# Altium project LEFT-Bone_Conduction_Glasses-v1.0.PrjPcb
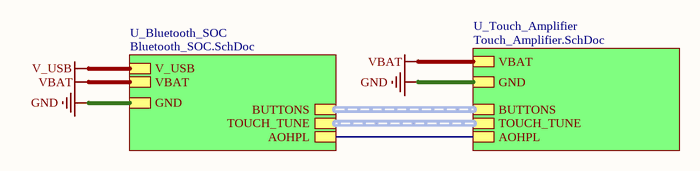
[diagram p0: Top_Sheet.SchDoc]
3 sheets, 85 parts. Net scope: hierarchical (ports join the sheet entries above them; power ports are global).
Board file: Left-PCB-v1.0.PcbDoc
Sheets:
  Top_Sheet.SchDoc
    U_Touch_Amplifier = Touch_Amplifier.SchDoc
    U_Bluetooth_SOC = Bluetooth_SOC.SchDoc

## Sheet Top_Sheet.SchDoc
size A4; SheetNumber: 1; SheetTotal: 3

### Sub-sheets
U_Bluetooth_SOC = Bluetooth_SOC.SchDoc: BUTTONS (harness BUTTONS), TOUCH_TUNE (harness TOUCH_TUNE), GND, VBAT, V_USB, AOHPL
U_Touch_Amplifier = Touch_Amplifier.SchDoc: BUTTONS (harness BUTTONS), TOUCH_TUNE (harness TOUCH_TUNE), GND, VBAT, AOHPL

### Nets
GND: sheet U_Touch_Amplifier/GND, sheet U_Bluetooth_SOC/GND
VBAT: sheet U_Touch_Amplifier/VBAT, sheet U_Bluetooth_SOC/VBAT
AOHPL: sheet U_Touch_Amplifier/AOHPL, sheet U_Bluetooth_SOC/AOHPL

### Buses and harness runs
harness sheet U_Bluetooth_SOC/BUTTONS = sheet U_Touch_Amplifier/BUTTONS
harness sheet U_Bluetooth_SOC/TOUCH_TUNE = sheet U_Touch_Amplifier/TOUCH_TUNE

### Notes on the sheet
- File:
- Title:
- Date:
- Page
- Num:
- Total:
- Drawn By: Huzaifa Ali

## Sheet Touch_Amplifier.SchDoc
size 420 x 297 mm; SheetNumber: 3; SheetTotal: 3
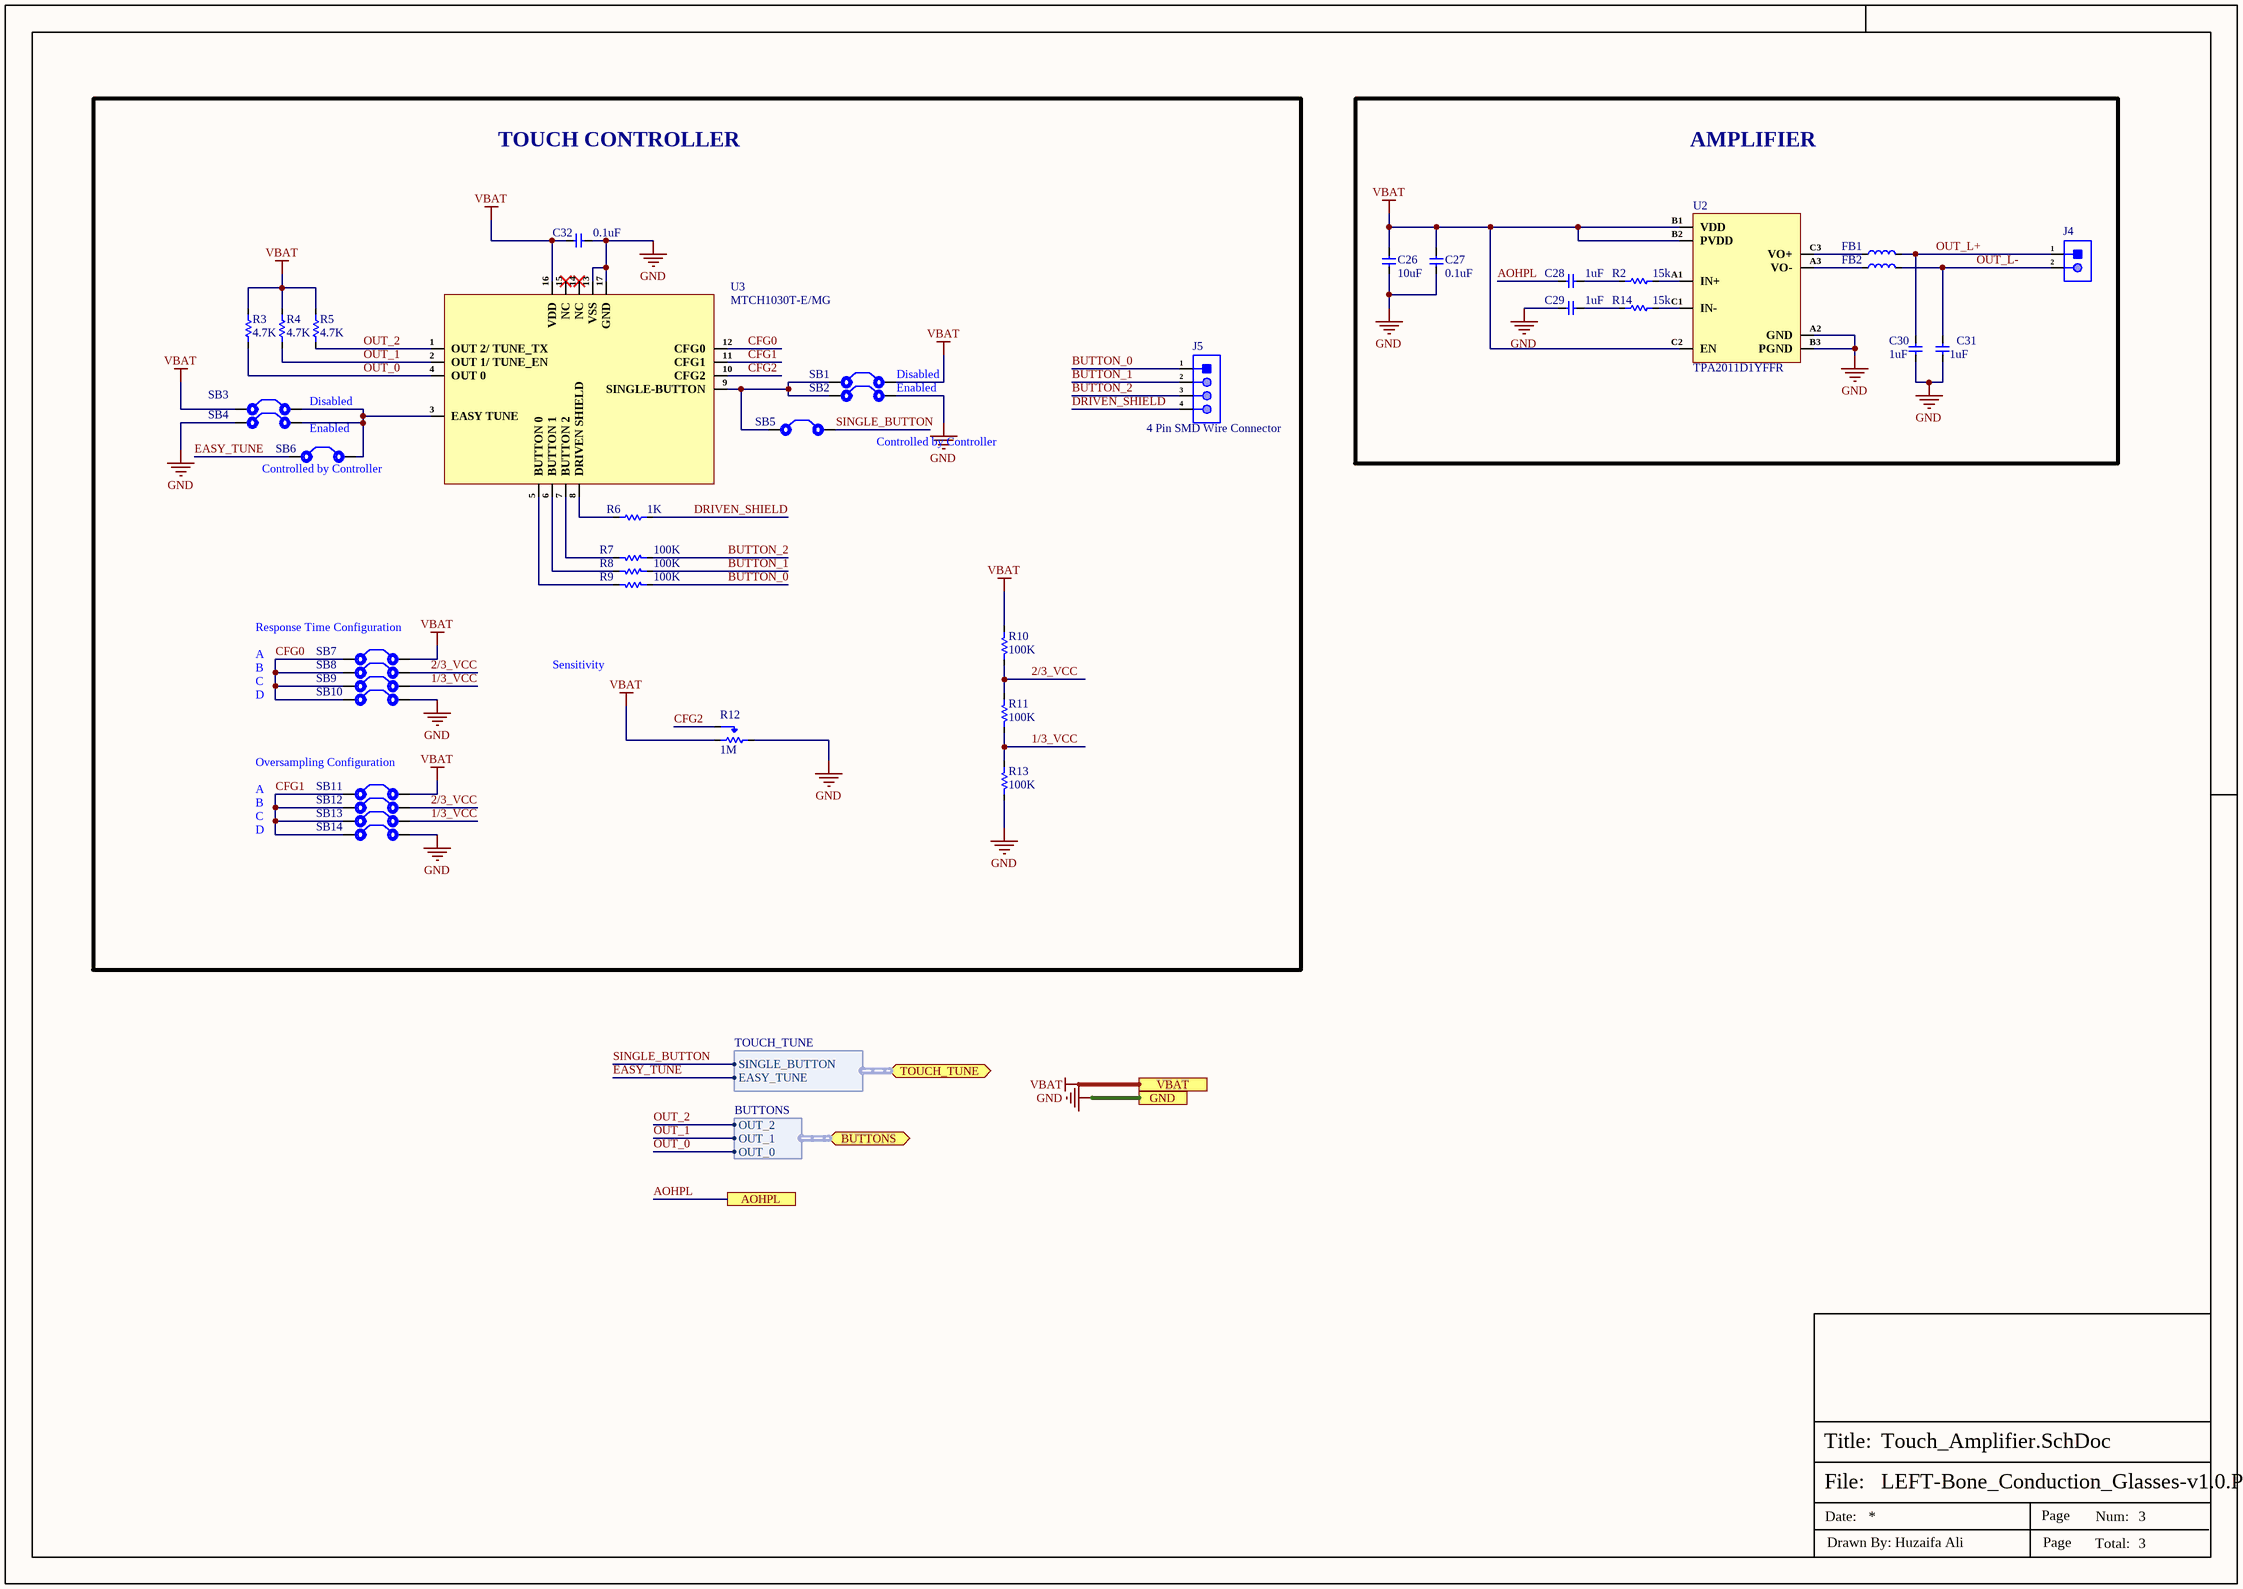
[diagram p1: Touch_Amplifier.SchDoc]

### Parts
C26  10uF  [Cap-0402]
C27  0.1uF  [CAP-0201]
C28  1uF  [Cap-0201]
C29  1uF  [Cap-0201]
C30  1uF  [Cap-0201]
C31  1uF  [Cap-0201]
C32  0.1uF  [CAP-0201]
FB1  MPZ1608S221ATA00  [IND-0603 (1608 Metric)]  (value not drawn)
FB2  MPZ1608S221ATA00  [IND-0603 (1608 Metric)]  (value not drawn)
J4  2 Test Pad  [2 Test Pad]  (value not drawn)
J5  4 Pin SMD Wire Connector  [4 Pin SMD Wire CON.]
R2  15k  [Res-0201]
R3  4.7K  [Res-0201]
R4  4.7K  [Res-0201]
R5  4.7K  [Res-0201]
R6  1K  [Res-0201]
R7  100K  [Res-0201]
R8  100K  [Res-0201]
R9  100K  [Res-0201]
R10  100K  [Res-0201]
R11  100K  [Res-0201]
R12  1M  [TC33X-2-105E]
R13  100K  [Res-0201]
R14  15k  [Res-0201]
SB1  Solder Bridge 0402  [Solder Bridge 0402]  (value not drawn)
SB2  Solder Bridge 0402  [Solder Bridge 0402]  (value not drawn)
SB3  Solder Bridge 0402  [Solder Bridge 0402]  (value not drawn)
SB4  Solder Bridge 0402  [Solder Bridge 0402]  (value not drawn)
SB5  Solder Bridge 0402  [Solder Bridge 0402]  (value not drawn)
SB6  Solder Bridge 0402  [Solder Bridge 0402]  (value not drawn)
SB7  Solder Bridge 0402  [Solder Bridge 0402]  (value not drawn)
SB8  Solder Bridge 0402  [Solder Bridge 0402]  (value not drawn)
SB9  Solder Bridge 0402  [Solder Bridge 0402]  (value not drawn)
SB10  Solder Bridge 0402  [Solder Bridge 0402]  (value not drawn)
SB11  Solder Bridge 0402  [Solder Bridge 0402]  (value not drawn)
SB12  Solder Bridge 0402  [Solder Bridge 0402]  (value not drawn)
SB13  Solder Bridge 0402  [Solder Bridge 0402]  (value not drawn)
SB14  Solder Bridge 0402  [Solder Bridge 0402]  (value not drawn)
U2  TPA2011D1YFFR  [9-DSBGA]
U3  MTCH1030T-E/MG  [16-QFN (3x3).]

### Blocks framed on the sheet
TOUCH CONTROLLER: C32 J5 R3-R13 SB1-SB14 U3
AMPLIFIER: C26-C31 FB1 FB2 J4 R2 R14 U2

### Ports
AOHPL, BUTTONS (bidir, harness BUTTONS), GND, TOUCH_TUNE (bidir, harness TOUCH_TUNE), VBAT

### Harnesses
BUTTONS: OUT_2, OUT_1, OUT_0
TOUCH_TUNE: SINGLE_BUTTON, EASY_TUNE

### Nets
GND: C26.1 C27.1 C29.1 C30.1 C31.1 C32.2 R12.3(CW) R13.2 SB2.1 SB4.1 SB10.2 SB14.2 U2.A2(GND) U2.B3(PGND) U3.13(VSS) U3.17(GND) ; port GND
VBAT: C26.2 C27.2 C32.1 R3.2 R4.2 R5.2 R10.1 R12.1(CCW) SB1.1 SB3.1 SB7.2 SB11.2 U2.B1(VDD) U2.B2(PVDD) U2.C2(EN) U3.16(VDD) ; port VBAT
1/3_VCC: R11.2 R13.1 SB9.2 SB13.2
2/3_VCC: R10.2 R11.1 SB8.2 SB12.2
AOHPL: C28.1 ; port AOHPL
BUTTON_0: J5.1 R9.1
BUTTON_1: J5.2 R8.1
BUTTON_2: J5.3 R7.1
CFG0: SB7.1 SB8.1 SB9.1 SB10.1 U3.12(CFG0)
CFG1: SB11.1 SB12.1 SB13.1 SB14.1 U3.11(CFG1)
CFG2: R12.2(Wiper) U3.10(CFG2)
DRIVEN_SHIELD: J5.4 R6.2
EASY_TUNE: SB6.1 ; port TOUCH_TUNE.EASY_TUNE
OUT_0: R3.1 U3.4(OUT_0) ; port BUTTONS.OUT_0
OUT_1: R4.1 U3.2(OUT_1/_TUNE_EN) ; port BUTTONS.OUT_1
OUT_2: R5.1 U3.1(OUT_2/_TUNE_TX) ; port BUTTONS.OUT_2
OUT_L+: C30.2 FB1.2 J4.1
OUT_L-: C31.2 FB2.2 J4.2
SINGLE_BUTTON: SB5.1 ; port TOUCH_TUNE.SINGLE_BUTTON
NetC28_2: C28.2 R2.1
NetC29_2: C29.2 R14.1
NetFB1_1: FB1.1 U2.C3(VO+)
NetFB2_1: FB2.1 U2.A3(VO-)
NetR2_2: R2.2 U2.A1(IN+)
NetR6_1: R6.1 U3.8(DRIVEN_SHIELD)
NetR7_2: R7.2 U3.7(BUTTON_2)
NetR8_2: R8.2 U3.6(BUTTON_1)
NetR9_2: R9.2 U3.5(BUTTON_0)
NetR14_2: R14.2 U2.C1(IN-)
NetSB1_2: SB1.2 SB2.2 SB5.2 U3.9(SINGLE-BUTTON)
NetSB3_2: SB3.2 SB4.2 SB6.2 U3.3(EASY_TUNE)

Not connected (* = marked no-connect by the designer): U3 14(NC)* 15(NC)*

### Notes on the sheet
- Enabled
- Disabled
- (near SB5) Controlled by Controller
- (near SB6) Controlled by Controller
- Text
- Sensitivity
- Response Time Configuration
  A
  B
  C
  D
- Oversampling Configuration
  A
  B
  C
  D
- File:
- Title:
- Date:
- Page
- Num:
- Total:
- Drawn By: Huzaifa Ali

### Library data of the parts
C26 = CL05A106MP5NUNC: CAP CER 10UF 10V X5R 0402; Manufacturer: Samsung; Tolerance: 20%; Item Type: Capacitor; Supplier 1: Avnet; Manufacturer Part Number: CL05A106MP5NUNC; RoHS: Yes; Category: Ceramic Capacitors; Stock 1: 1729850; Pricing 1: 10000=0.02537 (USD); Mount: Surface Mount; Case/Package: 0402; Case Code (Metric): 1005; Case Code (Imperial): 0402; Contact Plating: Tin; Min Operating Temperature: -55°C; Max Operating Temperature: 85°C; Package Quantity: 1; Packaging: Tape and Reel; Capacitance: 10uF; Voltage Rating: 10V; Dielectric: X5R; Termination: Wraparound; Series: CL; Construction: Flat; Length: 1mm; Width: 0.02inch; Thickness: 0.028inch; Depth: 0.5mm; Radiation Hardening: No; Lead Free: Lead Free; RoHS Compliant: Yes; ComponentLink1URL: https://datasheet.ciiva.com/25721/cl05a106mp5nunc-25721584.pdf?src-supplier=Digi-Key; ComponentLink1Description: https://datasheet.ciiva.com/25721/cl05a106mp5nunc-25721584.pdf?src-supplier=Digi-Key; ComponentLink2URL: https://datasheet.ciiva.com/26838/getdatasheetpartid-745310-26838170.pdf?src-supplier=Verical; ComponentLink2Description: https://datasheet.ciiva.com/26838/getdatasheetpartid-745310-26838170.pdf?src-supplier=Verical; Supplier Part Number 1: CL05A106MP5NUNC; LCSC Part Number: C315248
C27 C32 = CC0201KRX5R6BB104: CAP CER 0.1UF 10V X5R 0201; Manufacturer: Yageo; Capacitance: 100nF; Tolerance: 10%; Supplier 1: Mouser; Manufacturer Part Number: CC0201KRX5R6BB104; RoHS: Yes; Category: Ceramic Capacitors; Stock 1: 824403; Pricing 1: 1=0.10000, 10=0.02400, 50=0.02400, 100=0.01900, 1000=0.01100, 10000=0.00900 (USD); Mount: Surface Mount; Case/Package: 0201; Case Code (Imperial): 0201; Case Code (Metric): 0603; Weight: 6E-06oz; Min Operating Temperature: -55°C; Max Operating Temperature: 85°C; Dielectric: X5R; Voltage Rating (DC): 10V; Packaging: Tape and Reel; Termination: SMD/SMT; Resistor Type: Ceramic; Voltage Rating: 10V; Series: CC; Construction: Flat; Length: 0.6mm; Width: 0.012inch; Height: 0.3mm; Thickness: 0.013inch; Depth: 0.3mm; Radiation Hardening: No; Lead Free: Lead Free; Halogen Free: Halogen Free; RoHS Compliant: Yes; ComponentLink1URL: https://datasheet.ciiva.com/11587/upy-gphc-x5r-4v-to-50v-12-11587190.pdf?src-supplier=Avnet; ComponentLink1Description: https://datasheet.ciiva.com/11587/upy-gphc-x5r-4v-to-50v-12-11587190.pdf?src-supplier=Avnet; Supplier Part Number 1: 603-CC201KRX5R6BB104; LCSC Part Number: C190183
C28-C31 = CC0201KRX5R5BB105: CAP CER 1UF 6.3V X5R 0201; Manufacturer: Yageo; Tolerance: 10%; Item Type: Capacitor; Supplier 1: Arrow Electronics; Manufacturer Part Number: CC0201KRX5R5BB105; RoHS: Yes; Category: Ceramic Capacitors; Stock 1: 600000; Pricing 1: 15000=0.00740 (USD); Mount: Surface Mount; Case/Package: 0201; Case Code (Imperial): 0201; Case Code (Metric): 0603; Min Operating Temperature: -55°C; Max Operating Temperature: 85°C; Packaging: Cut Tape; Capacitance: 1uF; Voltage Rating: 6.3V; RoHS Compliant: Yes; ComponentLink1URL: http://www.yageo.com/documents/recent/UPY-GPHC_X5R_4V-to-50V_25.pdf?src-supplier=Digi-Key; ComponentLink1Description: http://www.yageo.com/documents/recent/UPY-GPHC_X5R_4V-to-50V_25.pdf?src-supplier=Digi-Key; ComponentLink2URL: https://www.yageo.com/upload/media/product/productsearch/datasheet/mlcc/UPY-GPHC_X5R_4V-to-50V_26.pdf?src-supplier=Digi-Key; ComponentLink2Description: https://www.yageo.com/upload/media/product/productsearch/datasheet/mlcc/UPY-GPHC_X5R_4V-to-50V_26.pdf?src-supplier=Digi-Key; Supplier Part Number 1: CC0201KRX5R5BB105; LCSC Part Number: C541330
FB1 FB2 = MPZ1608S221ATA00: FERRITE BEAD 220 OHM 0603 1LN; Manufacturer: TDK; Current Rating: 2.2A; Tolerance: 25%; Impedance: 220R; DC Resistance (DCR): 50mR; Test Frequency: 100MHz; Number of Lines: 1; Supplier: Avnet; Supplier Part Number: MPZ1608S221ATA00; Manufacturer Part Number: MPZ1608S221ATA00; RoHS: Yes; Category: Ferrite Beads and Chips; Stock: 4000; Pricing: 4000=0.02405, 8000=0.02275, 16000=0.02145, 24000=0.01953, 32000=0.01827 (USD); Mounting Technology: Surface Mount; Case/Package: 0603; Pins: 2; Case Code (Imperial): 0603; Core Material: Ferrite; Case Code (Metric): 1608; Packaging: Cut Tape; Package Quantity: 1; Max DC Current: 2.2A; Series: MPZ; Max Current Rating: 2.2A; RMS Current (Irms): 2.2A; ESR: 50mR; Length: 0.063inch; Width: 0.031inch; Height: 0.037inch; Lead Free: Lead Free; RoHS Compliant: Yes; Reach SVHC Compliant: No; ComponentLink1URL: https://datasheet.ciiva.com/8077/55167-8077073.pdf?src-supplier=Element14; ComponentLink1Description: https://datasheet.ciiva.com/8077/55167-8077073.pdf?src-supplier=Element14; ComponentLink2URL: https://datasheet.ciiva.com/8077/55167-8077071.pdf?src-supplier=Element14; ComponentLink2Description: https://datasheet.ciiva.com/8077/55167-8077071.pdf?src-supplier=Element14; ComponentLink3URL: https://datasheet.ciiva.com/46381/1486324-46381628.pdf?src-supplier=Element14; ComponentLink3Description: https://datasheet.ciiva.com/46381/1486324-46381628.pdf?src-supplier=Element14; ComponentLink4URL: https://datasheet.ciiva.com/46366/print-detail-pdf-phplangenpart-nompz1608s221ata00nreimp-unit-xmhz-46366044.pdf?src-supplier=Onlinecomponents.com; ComponentLink4Description: https://datasheet.ciiva.com/46366/print-detail-pdf-phplangenpart-nompz1608s221ata00nreimp-unit-xmhz-46366044.pdf?src-supplier=Onlinecomponents.com; LCSC Part Number: C76815; Item Type: Ferrite Bead
J4 = 2 Test Pad: Wire Connecting Pad; Item Type: Test Point; Manufacturer Part Number: 2 Test Pad
J5 = 4 Pin SMD Wire Connector: Wire Connecting Pads; Item Type: SMD Pads; Manufacturer Part Number: 4 Pin SMD Wire Connector
R2 R14 = RC0201FR-0715KL: RES 15K OHM 1% 1/20W 0201; Manufacturer: Yageo; Voltage Rating (DC): 25V; Item Type: Resistor; Supplier 1: Future Electronics; Manufacturer Part Number: RC0201FR-0715KL; RoHS: Yes; Category: Chip SMD Resistors; Stock 1: 360000; Pricing 1: 10000=0.0035, 50000=0.0033, 250000=0.0031, 750000=0.003, 2000000=0.0028 (USD); Lead Free: 5697LeadFree; ComponentLink1URL: https://datasheet.ciiva.com/6002/1563626-6002808.pdf?src-supplier=Farnell; ComponentLink1Description: https://datasheet.ciiva.com/6002/1563626-6002808.pdf?src-supplier=Farnell; ComponentLink2URL: https://datasheet.ciiva.com/22661/1563626-22661288.pdf?src-supplier=Element14; ComponentLink2Description: https://datasheet.ciiva.com/22661/1563626-22661288.pdf?src-supplier=Element14; Supplier Part Number 1: 9770686; LCSC Part Number: C295774
R3-R5 = RC0201FR-074K7L: RES 4.7K OHM 1% 1/20W 0201; Manufacturer: Yageo; Item Type: Resistor; Supplier: Future Electronics; Supplier Part Number: 7537285; Manufacturer Part Number: RC0201FR-074K7L; RoHS: Yes; Category: Chip SMD Resistors; Stock: 1610000; Pricing: 10000=0.0014, 50000=0.0013, 250000=0.0013, 750000=0.0012, 2000000=0.0011 (USD); ComponentLink1URL: https://datasheet.ciiva.com/2493/pyu-r-int-thick-7-2493811.pdf?src-supplier=Digi-Key; ComponentLink1Description: https://datasheet.ciiva.com/2493/pyu-r-int-thick-7-2493811.pdf?src-supplier=Digi-Key; ComponentLink2URL: https://datasheet.ciiva.com/2493/pyu-r-int-thick-7-2493812.pdf?src-supplier=Digi-Key; ComponentLink2Description: https://datasheet.ciiva.com/2493/pyu-r-int-thick-7-2493812.pdf?src-supplier=Digi-Key; ComponentLink3URL: https://datasheet.ciiva.com/2493/pyu-r-int-thick-7-2493813.pdf?src-supplier=Digi-Key; ComponentLink3Description: https://datasheet.ciiva.com/2493/pyu-r-int-thick-7-2493813.pdf?src-supplier=Digi-Key; ComponentLink4URL: https://datasheet.ciiva.com/8892/pyu-rc0201-51-rohs-l-8-8892942.pdf?src-supplier=Avnet; ComponentLink4Description: https://datasheet.ciiva.com/8892/pyu-rc0201-51-rohs-l-8-8892942.pdf?src-supplier=Avnet; ComponentLink5URL: https://datasheet.ciiva.com/7672/1563626-7672233.pdf?src-supplier=Element14; ComponentLink5Description: https://datasheet.ciiva.com/7672/1563626-7672233.pdf?src-supplier=Element14; LCSC Part Number: C138135
R6 = RC0201FR-071KP: RES 1K OHM 1% 1/20W 0201; Manufacturer: Yageo; Supplier 1: Digi-Key; Manufacturer Part Number: RC0201FR-071KP; RoHS: Yes; Stock 1: 4800; Pricing 1: 1=0.11000, 10=0.10200, 100=0.03940, 1000=0.01734, 2500=0.01497, 5000=0.01340 (USD); RoHS Compliant: Yes; Supplier Part Number 1: 13-RC0201FR-071KPCT-ND; LCSC Part Number: C3953443
R7-R11 R13 = RC0201FR-07100KL: RES 100K OHM 1% 1/20W 0201; Manufacturer: Yageo; Resistance: 100kR; Temperature Coefficient: 200ppm/°C; Power Rating: 50mW; Voltage Rating: 25V; Supplier 1: Digi-Key; Manufacturer Part Number: RC0201FR-07100KL; RoHS: Yes; Category: Chip SMD Resistors; Stock 1: 6740592; Pricing 1: 1=0.10000, 10=0.03900, 100=0.01570, 1000=0.00705, 2500=0.00612, 5000=0.00506 (USD); Case/Package: 0201; Number of Pins: 2; Contact Plating: Tin,Matte; Case Code (Imperial): 0201; Case Code (Metric): 0603; Size Code: 0201; Min Operating Temperature: -55°C; Max Operating Temperature: 125°C; Tolerance: 1%; Resistor Type: Thick Film; Packaging: Tape and Reel; Package Quantity: 10000; Termination: SMD/SMT; Number of Terminations: 2; Max Power Dissipation: 50mW; Voltage Rating (DC): 25V; Features: Moisture Resistant; Series: RC; Resistance Tolerance: 1%; Construction: Rectangular; Length: 0.024inch; Width: 0.012inch; Height: 0.01inch; Depth: 0.3mm; REACH SVHC: No SVHC; Military Standard: Not; Lead Free: Lead Free; RoHS Compliant: Yes; ComponentLink1URL: https://datasheet.ciiva.com/7660/1421516-7660806.pdf?src-supplier=Element14; ComponentLink1Description: https://datasheet.ciiva.com/7660/1421516-7660806.pdf?src-supplier=Element14; ComponentLink2URL: https://datasheet.ciiva.com/22698/1563626-22698495.pdf?src-supplier=Element14; ComponentLink2Description: https://datasheet.ciiva.com/22698/1563626-22698495.pdf?src-supplier=Element14; ComponentLink3URL: https://datasheet.ciiva.com/46391/1421516-46391338.pdf?src-supplier=Element14; ComponentLink3Description: https://datasheet.ciiva.com/46391/1421516-46391338.pdf?src-supplier=Element14; ComponentLink4URL: https://datasheet.ciiva.com/2493/pyu-r-int-thick-7-2493770.pdf?src-supplier=Digi-Key; ComponentLink4Description: https://datasheet.ciiva.com/2493/pyu-r-int-thick-7-2493770.pdf?src-supplier=Digi-Key; ComponentLink5URL: https://datasheet.ciiva.com/2493/pyu-r-int-thick-7-2493771.pdf?src-supplier=Digi-Key; ComponentLink5Description: https://datasheet.ciiva.com/2493/pyu-r-int-thick-7-2493771.pdf?src-supplier=Digi-Key; ComponentLink6URL: https://datasheet.ciiva.com/2493/pyu-r-int-thick-7-2493769.pdf?src-supplier=Digi-Key; ComponentLink6Description: https://datasheet.ciiva.com/2493/pyu-r-int-thick-7-2493769.pdf?src-supplier=Digi-Key; ComponentLink7URL: https://datasheet.ciiva.com/26829/getdatasheetpartid-420441-26829850.pdf?src-supplier=Verical; ComponentLink7Description: https://datasheet.ciiva.com/26829/getdatasheetpartid-420441-26829850.pdf?src-supplier=Verical; Supplier Part Number 1: 311-100KMCT-ND
R12 = TC33X-2-105E: TRIMMER 1M OHM 0.1W J LEAD TOP; Manufacturer: Bourns; Item Type: Variable Resistor; Supplier: Arrow Electronics; Supplier Part Number: TC33X-2-105E; Manufacturer Part Number: TC33X-2-105E; RoHS: Yes; Category: Variable Resistors and Potentiometers; Stock: 5461; Pricing: 1=0.2738, 10=0.235, 25=0.2264, 100=0.2108, 250=0.2012, 500=0.1814, 1000=0.1356, 3000=0.126 (USD); ComponentLink1URL: https://datasheet.ciiva.com/6227/tc33-6227126.pdf?src-supplier=Digi-Key; ComponentLink1Description: https://datasheet.ciiva.com/6227/tc33-6227126.pdf?src-supplier=Digi-Key; ComponentLink2URL: https://datasheet.ciiva.com/43453/306tc33-43453797.pdf?src-supplier=Onlinecomponents.com; ComponentLink2Description: https://datasheet.ciiva.com/43453/306tc33-43453797.pdf?src-supplier=Onlinecomponents.com; LCSC Part Number: C5362465
SB1-SB14 = Solder Bridge 0402: Solder Bridge ON; Manufacturer Part Number: Solder Bridge 0402; Item Type: Solder Bridge
U2 = TPA2011D1YFFR: IC AMP AUDIO PWR 3.2W D 9DSBGA; Manufacturer: Texas Instruments; Max Power Dissipation: 525mW; Max Supply Voltage: 5.5V; Min Supply Voltage: 2.5V; Max Output Power: 3.24W; Number of Channels: 1; Power Supply Rejection Ratio (PSRR): 86dB; Quiescent Current: 1.8mA; Supply Current: 1.5mA; Supplier 1: Mouser; Manufacturer Part Number: TPA2011D1YFFR; RoHS: Yes; Category: Amplifiers - Audio; Stock 1: 6964; Pricing 1: 1=0.83, 10=0.698, 50=0.698, 100=0.529, 1000=0.353, 10000=0.293 (USD); Case/Package: BGA; Number of Pins: 9; Min Operating Temperature: -40°C; Max Operating Temperature: 85°C; Output Power: 3.2W; Series: -; Packaging: Tape and Reel; Package Quantity: 3000; Power Dissipation: 525mW; Radiation Hardening: No; Lead Free: Lead Free; RoHS Compliant: Yes; ComponentLink1URL: https://datasheet.ciiva.com/1789/tpa2011d1-1789073.pdf?src-supplier=Digi-Key; ComponentLink1Description: https://datasheet.ciiva.com/1789/tpa2011d1-1789073.pdf?src-supplier=Digi-Key; ComponentLink2URL: https://datasheet.ciiva.com/1789/tpa2011d1-1789074.pdf?src-supplier=Digi-Key; ComponentLink2Description: https://datasheet.ciiva.com/1789/tpa2011d1-1789074.pdf?src-supplier=Digi-Key; ComponentLink3URL: https://datasheet.ciiva.com/1789/tpa2011d1-1789075.pdf?src-supplier=Digi-Key; ComponentLink3Description: https://datasheet.ciiva.com/1789/tpa2011d1-1789075.pdf?src-supplier=Digi-Key; ComponentLink4URL: https://datasheet.ciiva.com/15223/getdatasheetpartid-306371-15223959.pdf?src-supplier=Verical; ComponentLink4Description: https://datasheet.ciiva.com/15223/getdatasheetpartid-306371-15223959.pdf?src-supplier=Verical; Supplier Part Number 1: 595-TPA2011D1YFFR; LCSC Part Number: C468251; Item Type: IC
U3 = MTCH1030T-E/MG: 3 CHANNEL TOUCH CONTROLLER, GPIO; Manufacturer: Microchip; Item Type: IC; Supplier: Digi-Key; Supplier Part Number: 150-MTCH1030T-E/MGCT-ND; Manufacturer Part Number: MTCH1030T-E/MG; RoHS: No; Stock: 3300; Pricing: 1=1, 25=0.92, 100=0.83 (USD)

## Sheet Bluetooth_SOC.SchDoc
size 420 x 297 mm; SheetNumber: 2; SheetTotal: 3
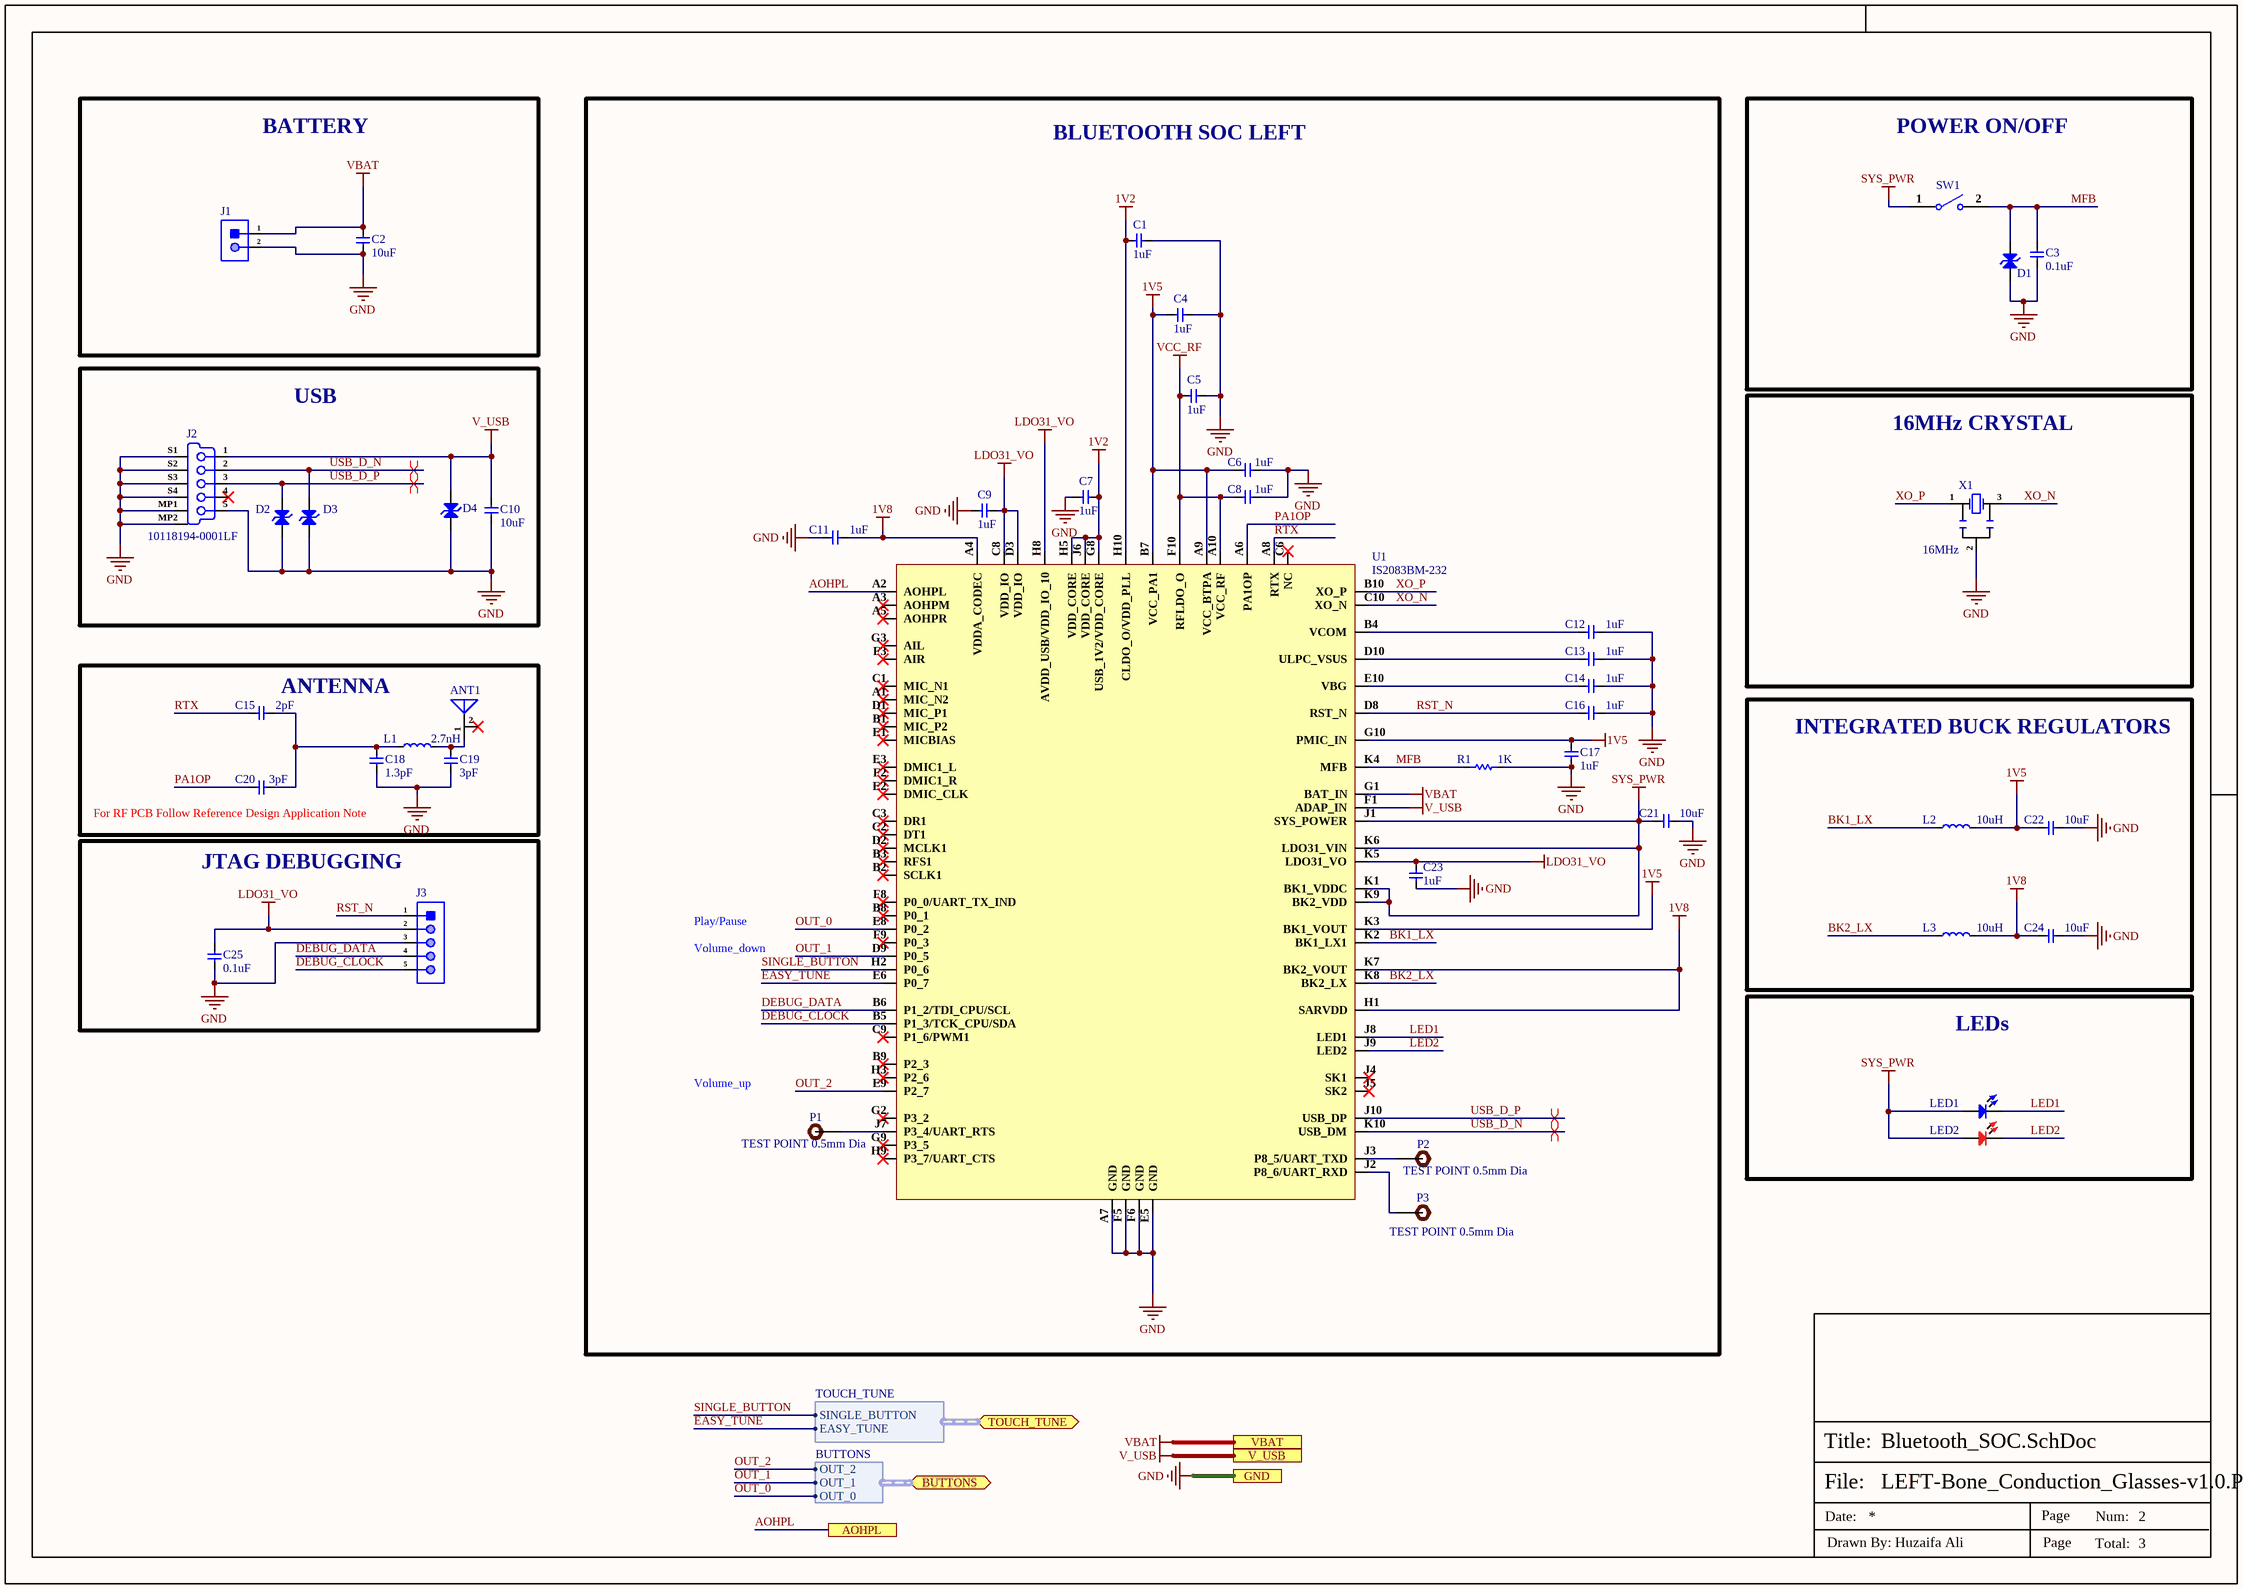
[diagram p2: Bluetooth_SOC.SchDoc]

### Parts
ANT1  ANT3216LL00R2400A  [ANT3216LL00R2400A]  (value not drawn)
C1  1uF  [Cap-0201]
C2  10uF  [Cap-0402]
C3  0.1uF  [CAP-0201]
C4  1uF  [Cap-0201]
C5  1uF  [Cap-0201]
C6  1uF  [Cap-0201]
C7  1uF  [Cap-0201]
C8  1uF  [Cap-0201]
C9  1uF  [Cap-0201]
C10  10uF  [Cap-0402]
C11  1uF  [Cap-0201]
C12  1uF  [Cap-0201]
C13  1uF  [Cap-0201]
C14  1uF  [Cap-0201]
C15  2pF  [CAP-0201]
C16  1uF  [Cap-0201]
C17  1uF  [Cap-0201]
C18  1.3pF  [CAP-0201]
C19  3pF  [CAP-0201]
C20  3pF  [CAP-0201]
C21  10uF  [Cap-0402]
C22  10uF  [Cap-0402]
C23  1uF  [Cap-0201]
C24  10uF  [Cap-0402]
C25  0.1uF  [CAP-0201]
D1  PESD5V0H1BSFYL  [DSN0603-2]  (value not drawn)
D2  PESD5V0H1BSFYL  [DSN0603-2]  (value not drawn)
D3  PESD5V0H1BSFYL  [DSN0603-2]  (value not drawn)
D4  PESD5V0H1BSFYL  [DSN0603-2]  (value not drawn)
J1  2 Test Pad  [2 Test Pad]  (value not drawn)
J2  10118194-0001LF  [10118194-0001LF_]
J3  5 Test Pad  [5 Test Pad]  (value not drawn)
L1  2.7nH  [IND-0201]
L2  10uH  [IND-0603 (1608 Metric)]
L3  10uH  [IND-0603 (1608 Metric)]
LED1  Blue  [LED-0603]  (value not drawn)
LED2  RED  [LED-0603]  (value not drawn)
P1  TEST POINT 0.5mm Dia  [Test-point - 0.5mm]
P2  TEST POINT 0.5mm Dia  [Test-point - 0.5mm]
P3  TEST POINT 0.5mm Dia  [Test-point - 0.5mm]
R1  1K  [Res-0201]
SW1  B3U-1000P  [B3U-1000P]  (value not drawn)
U1  IS2083BM-232  [82-VFBGA]
X1  16MHz  [SMD3213-3P]

### Blocks framed on the sheet
BATTERY: C2 J1
BLUETOOTH SOC LEFT: C1 C4-C9 C11-C14 C16 C17 C21 C23 P1-P3 R1 U1
POWER ON/OFF: C3 D1 SW1
USB: C10 D2-D4 J2
16MHz CRYSTAL: X1
ANTENNA: ANT1 C15 C18-C20 L1
INTEGRATED BUCK REGULATORS: C22 C24 L2 L3
JTAG DEBUGGING: C25 J3
LEDs: LED1 LED2

### Ports
AOHPL, BUTTONS (bidir, harness BUTTONS), GND, TOUCH_TUNE (bidir, harness TOUCH_TUNE), V_USB, VBAT

### Harnesses
BUTTONS: OUT_2, OUT_1, OUT_0
TOUCH_TUNE: SINGLE_BUTTON, EASY_TUNE

### Nets
1V2: C1.1 C7.1 U1.G8(USB_1V2/VDD_CORE) U1.H5(VDD_CORE) U1.H10(CLDO_O/VDD_PLL) U1.J6(VDD_CORE)
1V5: C4.2 C6.2 C17.2 C22.2 L2.2 U1.A9(VCC_BTPA) U1.B7(VCC_PA1) U1.G10(PMIC_IN) U1.K3(BK1_VOUT)
1V8: C11.2 C24.2 L3.2 U1.A4(VDDA_CODEC) U1.H1(SARVDD) U1.K7(BK2_VOUT)
GND: C1.2 C2.2 C3.1 C4.1 C5.1 C6.1 C7.2 C8.1 C9.2 C10.2 C11.1 C12.2 C13.2 C14.2 C16.2 C17.1 C18.1 C19.1 C21.1 C22.1 C23.1 C24.1 C25.1 D1.1(A) D2.1(A) D3.1(A) D4.1(A) J1.2 J2.5(GND) J2.MP1(Tab) J2.MP2(Tab) J2.S1(Shield) J2.S2(Shield) J2.S3(Shield) J2.S4(Shield) J3.3 R1.2 U1.A7(GND) U1.E5(GND) U1.F5(GND) U1.F6(GND) X1.2 ; port GND
LDO31_VO: C9.1 C23.2 C25.2 J3.2 U1.C8(VDD_IO) U1.D3(VDD_IO) U1.H8(AVDD_USB/VDD_IO_10) U1.K5(LDO31_VO)
SYS_PWR: C21.2 LED1.1 LED2.1 SW1.1 U1.J1(SYS_POWER) U1.K1(BK1_VDDC) U1.K6(LDO31_VIN) U1.K9(BK2_VDD)
V_USB: C10.1 D4.2(A) J2.1(V_BUS_(5V)) U1.F1(ADAP_IN) ; port V_USB
VBAT: C2.1 J1.1 U1.G1(BAT_IN) ; port VBAT
VCC_RF: C5.2 C8.2 U1.A10(VCC_RF) U1.F10(RFLDO_O)
AOHPL: U1.A2(AOHPL) ; port AOHPL
BK1_LX: L2.1 U1.K2(BK1_LX1)
BK2_LX: L3.1 U1.K8(BK2_LX)
DEBUG_CLOCK: J3.5 U1.B5(P1_3/TCK_CPU/SDA)
DEBUG_DATA: J3.4 U1.B6(P1_2/TDI_CPU/SCL)
EASY_TUNE: U1.E6(P0_7) ; port TOUCH_TUNE.EASY_TUNE
LED1: LED1.2 U1.J8(LED1)
LED2: LED2.2 U1.J9(LED2)
MFB: C3.2 D1.2(A) R1.1 SW1.2 U1.K4(MFB)
OUT_0: U1.E8(P0_2) ; port BUTTONS.OUT_0
OUT_1: U1.D9(P0_5) ; port BUTTONS.OUT_1
OUT_2: U1.E9(P2_7) ; port BUTTONS.OUT_2
PA1OP: C20.1 U1.A6(PA1OP)
RST_N: C16.1 J3.1 U1.D8(RST_N)
RTX: C15.1 U1.A8(RTX)
SINGLE_BUTTON: U1.H2(P0_6) ; port TOUCH_TUNE.SINGLE_BUTTON
USB_D_N: D3.2(A) J2.2(D-) U1.K10(USB_DM)
USB_D_P: D2.2(A) J2.3(D+) U1.J10(USB_DP)
XO_N: U1.C10(XO_N) X1.3(CRYSTAL)
XO_P: U1.B10(XO_P) X1.1(CRYSTAL)
NetANT1_1: ANT1.1(Feed) C19.2 L1.2
NetC12_1: C12.1 U1.B4(VCOM)
NetC13_1: C13.1 U1.D10(ULPC_VSUS)
NetC14_1: C14.1 U1.E10(VBG)
NetC15_2: C15.2 C18.2 C20.2 L1.1
NetP1_1: P1.1 U1.J7(P3_4/UART_RTS)
NetP2_1: P2.1 U1.J3(P8_5/UART_TXD)
NetP3_1: P3.1 U1.J2(P8_6/UART_RXD)

Not connected (* = marked no-connect by the designer): ANT1 2(NC)*; J2 4(NC)*; U1 A1(MIC_N2)* A3(AOHPM)* A5(AOHPR)* B1(MIC_P2)* B2(SCLK1)* B3(RFS1)* B8(P0_1)* B9(P2_3)* C1(MIC_N1)* C2(DT1)* C3(DR1)* C6(NC)* C9(P1_6/PWM1)* D1(MIC_P1)* D2(MCLK1)* E1(MICBIAS)* E2(DMIC_CLK)* E3(DMIC1_L)* F2(DMIC1_R)* F3(AIR)* F8(P0_0/UART_TX_IND)* F9(P0_3)* G2(P3_2)* G3(AIL)* G9(P3_5)* H3(P2_6)* H9(P3_7/UART_CTS)* J4(SK1)* J5(SK2)*

### Layout directives
differential pair; net class GSM_USB; differential pair class GSM_USB_Lines; rule Impedance Constraint [Min = 85.00    Max = 90.00    ]; rule Matched Net Lengths [Tolerance = 50mil]: USB_D_N, USB_D_P

### Notes on the sheet
- (near C20) For RF PCB Follow Reference Design Application Note
- Play/Pause
- Volume_down
- Volume_up
- File:
- Title:
- Date:
- Page
- Num:
- Total:
- Drawn By: Huzaifa Ali

### Library data of the parts
ANT1 = ANT3216LL00R2400A: 5.05dBi Chip antenna Linear 160MHz 2.45GHz 1W 1206 Antennas ROHS; Manufacturer: YAGEO; ComponentLink1Description: LCSC; ComponentLink1URL: https://www.lcsc.com/product-detail/Antennas_YAGEO-ANT3216LL00R2400A_C293767.html; Manufacturer Part Number: ANT3216LL00R2400A; Package: 1206; LCSC Part Number: C293767; Item Type: Antenna
C1 C4-C9 C11-C14 C16 C17 C23 = CC0201KRX5R5BB105: as C28 on sheet Touch_Amplifier; Supplier 1: Arrow Electronics; Manufacturer Part Number: CC0201KRX5R5BB105; RoHS: Yes; Category: Ceramic Capacitors; Stock 1: 600000; Pricing 1: 15000=0.00740 (USD); Mount: Surface Mount; Case/Package: 0201; Case Code (Imperial): 0201; Case Code (Metric): 0603; Min Operating Temperature: -55°C; Max Operating Temperature: 85°C; Packaging: Cut Tape; Capacitance: 1uF; Voltage Rating: 6.3V; RoHS Compliant: Yes; ComponentLink1URL: http://www.yageo.com/documents/recent/UPY-GPHC_X5R_4V-to-50V_25.pdf?src-supplier=Digi-Key; ComponentLink1Description: http://www.yageo.com/documents/recent/UPY-GPHC_X5R_4V-to-50V_25.pdf?src-supplier=Digi-Key; ComponentLink2URL: https://www.yageo.com/upload/media/product/productsearch/datasheet/mlcc/UPY-GPHC_X5R_4V-to-50V_26.pdf?src-supplier=Digi-Key; ComponentLink2Description: https://www.yageo.com/upload/media/product/productsearch/datasheet/mlcc/UPY-GPHC_X5R_4V-to-50V_26.pdf?src-supplier=Digi-Key; Supplier Part Number 1: CC0201KRX5R5BB105; LCSC Part Number: C541330
C2 C10 C21 C22 C24 = CL05A106MP5NUNC: as C26 on sheet Touch_Amplifier; Supplier 1: Avnet; Manufacturer Part Number: CL05A106MP5NUNC; RoHS: Yes; Category: Ceramic Capacitors; Stock 1: 1729850; Pricing 1: 10000=0.02537 (USD); Mount: Surface Mount; Case/Package: 0402; Case Code (Metric): 1005; Case Code (Imperial): 0402; Contact Plating: Tin; Min Operating Temperature: -55°C; Max Operating Temperature: 85°C; Package Quantity: 1; Packaging: Tape and Reel; Capacitance: 10uF; Voltage Rating: 10V; Dielectric: X5R; Termination: Wraparound; Series: CL; Construction: Flat; Length: 1mm; Width: 0.02inch; Thickness: 0.028inch; Depth: 0.5mm; Radiation Hardening: No; Lead Free: Lead Free; RoHS Compliant: Yes; ComponentLink1URL: https://datasheet.ciiva.com/25721/cl05a106mp5nunc-25721584.pdf?src-supplier=Digi-Key; ComponentLink1Description: https://datasheet.ciiva.com/25721/cl05a106mp5nunc-25721584.pdf?src-supplier=Digi-Key; ComponentLink2URL: https://datasheet.ciiva.com/26838/getdatasheetpartid-745310-26838170.pdf?src-supplier=Verical; ComponentLink2Description: https://datasheet.ciiva.com/26838/getdatasheetpartid-745310-26838170.pdf?src-supplier=Verical; Supplier Part Number 1: CL05A106MP5NUNC; LCSC Part Number: C315248
C3 C25 = CC0201KRX5R6BB104: as C27 on sheet Touch_Amplifier; Supplier 1: Mouser; Manufacturer Part Number: CC0201KRX5R6BB104; RoHS: Yes; Category: Ceramic Capacitors; Stock 1: 824403; Pricing 1: 1=0.10000, 10=0.02400, 50=0.02400, 100=0.01900, 1000=0.01100, 10000=0.00900 (USD); Mount: Surface Mount; Case/Package: 0201; Case Code (Imperial): 0201; Case Code (Metric): 0603; Weight: 6E-06oz; Min Operating Temperature: -55°C; Max Operating Temperature: 85°C; Dielectric: X5R; Voltage Rating (DC): 10V; Packaging: Tape and Reel; Termination: SMD/SMT; Resistor Type: Ceramic; Voltage Rating: 10V; Series: CC; Construction: Flat; Length: 0.6mm; Width: 0.012inch; Height: 0.3mm; Thickness: 0.013inch; Depth: 0.3mm; Radiation Hardening: No; Lead Free: Lead Free; Halogen Free: Halogen Free; RoHS Compliant: Yes; ComponentLink1URL: https://datasheet.ciiva.com/11587/upy-gphc-x5r-4v-to-50v-12-11587190.pdf?src-supplier=Avnet; ComponentLink1Description: https://datasheet.ciiva.com/11587/upy-gphc-x5r-4v-to-50v-12-11587190.pdf?src-supplier=Avnet; Supplier Part Number 1: 603-CC201KRX5R6BB104; LCSC Part Number: C190183
C15 = GRM0335C1E2R0BA01D: CAP CER 2PF 25V C0G/NP0 0201; Manufacturer: Murata; Item Type: Capacitor; Supplier 1: Arrow Electronics; Manufacturer Part Number: GRM0335C1E2R0BA01D; RoHS: Yes; Category: Ceramic Capacitors; Stock 1: 65754; Pricing 1: 1=0.053, 10=0.0058, 25=0.004, 100=0.0026, 500=0.0024, 1000=0.0023, 3000=0.0022, 6000=0.0021, 15000=0.002, 30000=0.0019 (USD); ComponentLink1URL: https://datasheet.ciiva.com/29535/grm0335c1e2r0ba01-01-29535294.pdf?src-supplier=Digi-Key; ComponentLink1Description: https://datasheet.ciiva.com/29535/grm0335c1e2r0ba01-01-29535294.pdf?src-supplier=Digi-Key; Supplier Part Number 1: GRM0335C1E2R0BA01D; LCSC Part Number: C161383
C18 = GRM0335C1H1R3BA01D: CAP CER 1.3PF 50V C0G/NP0 0201; Manufacturer: Murata; Material: 4241ConductorMaterial; Temperature Coefficient: 30ppm/°C; Item Type: Capacitor; Supplier 1: Arrow Electronics; Manufacturer Part Number: GRM0335C1H1R3BA01D; RoHS: Yes; Category: Ceramic Capacitors; Stock 1: 135000; Pricing 1: 15000=0.0024, 30000=0.0022, 75000=0.0018, 105000=0.0016, 150000=0.0015 (USD); Height: 330um; ComponentLink1URL: https://datasheet.ciiva.com/6270/partnumbering-e-01-6270997.pdf?src-supplier=Digi-Key; ComponentLink1Description: https://datasheet.ciiva.com/6270/partnumbering-e-01-6270997.pdf?src-supplier=Digi-Key; ComponentLink2URL: https://datasheet.ciiva.com/6271/partnumbering-e-01-6271000.pdf?src-supplier=Digi-Key; ComponentLink2Description: https://datasheet.ciiva.com/6271/partnumbering-e-01-6271000.pdf?src-supplier=Digi-Key; ComponentLink3URL: https://datasheet.ciiva.com/6271/partnumbering-e-01-6271002.pdf?src-supplier=Digi-Key; ComponentLink3Description: https://datasheet.ciiva.com/6271/partnumbering-e-01-6271002.pdf?src-supplier=Digi-Key; Supplier Part Number 1: GRM0335C1H1R3BA01D; LCSC Part Number: C237529
C19 C20 = GRM0335C1H3R0BA01D: CAP CER 3PF 50V C0G/NP0 0201; Manufacturer: Murata; Material: 4241ConductorMaterial; Temperature Coefficient: 30ppm/°C; Item Type: Capacitor; Supplier 1: Rs; Manufacturer Part Number: GRM0335C1H3R0BA01D; RoHS: Yes; Category: Ceramic Capacitors; Stock 1: 11000; Pricing 1: 1000=0.004, 5000=0.003, 10000=0.003 (GBP); Height: 330um; ComponentLink1URL: https://datasheet.ciiva.com/29538/partnumbering-e-01-29538501.pdf?src-supplier=Digi-Key; ComponentLink1Description: https://datasheet.ciiva.com/29538/partnumbering-e-01-29538501.pdf?src-supplier=Digi-Key; Supplier Part Number 1: 1851754; LCSC Part Number: C237430
D1-D4 = PESD5V0H1BSFYL: TVS DIODE 5VWM 6.3VC DSN0603-2; Manufacturer: Nexperia; Supplier 1: Avnet; Manufacturer Part Number: PESD5V0H1BSFYL; RoHS: Yes; Category: ESD and Circuit Protection ICs; Stock 1: 9000; Pricing 1: 18000=0.06453, 36000=0.06278, 54000=0.06104, 90000=0.05930, 180000=0.05755, 900000=0.05581, 1800000=0.05406 (USD); RoHS Compliant: Yes; ComponentLink1URL: http://www.farnell.com/datasheets/1961312.pdf?src-supplier=Farnell; ComponentLink1Description: http://www.farnell.com/datasheets/1961312.pdf?src-supplier=Farnell; ComponentLink2URL: https://assets.nexperia.com/documents/data-sheet/PESD5V0H1BSF.pdf?src-supplier=Digi-Key; ComponentLink2Description: https://assets.nexperia.com/documents/data-sheet/PESD5V0H1BSF.pdf?src-supplier=Digi-Key; ComponentLink3URL: http://www.farnell.com/datasheets/1961312.pdf?src-supplier=Newark; ComponentLink3Description: http://www.farnell.com/datasheets/1961312.pdf?src-supplier=Newark; Supplier Part Number 1: PESD5V0H1BSFYL; LCSC Part Number: C477989; Item Type: Diode
J1 = 2 Test Pad: as J4 on sheet Touch_Amplifier; Manufacturer Part Number: 2 Test Pad
J2 = 10118194-0001LF: CONN RCPT USB2.0 MICRO B SMD R/A; Manufacturer: Amphenol FCI; Gender: Receptacle; Current Rating: 1.8A; Connector Type: USB,Receptacle; Number of Contacts: 5; Insulation Resistance: 1GR; Number of Ports: 1; Max Voltage Rating (AC): 100V; Pitch: 0.65mm; Item Type: USB B Connector; Supplier 1: Digi-Key; Manufacturer Part Number: 10118194-0001LF; Stock 1: 35943; Pricing 1: 1=0.43, 10=0.405, 25=0.3648, 50=0.3242, 100=0.3107, 250=0.28368, 500=0.27016 (USD); Mount: Surface Mount,Horizontal; Color: Black; Contact Material: Copper Alloy; Contact Plating: Gold; Number of Terminals: 5; Housing Material: Polymer; Min Operating Temperature: -55°C; Max Operating Temperature: 85°C; Package Quantity: 9600; Packaging: Tape and Reel; Termination: Solder; Orientation: Right Angle; Features: Shielded; Length: 8.05mm; Depth: 5mm; Radiation Hardening: No; Lead Free: Lead Free; Flammability Rating: UL94 V-0; ComponentLink1URL: http://www.amphenol-icc.com/media/wysiwyg/files/drawing/10118194.pdf?src-supplier=Digi-Key; ComponentLink1Description: http://www.amphenol-icc.com/media/wysiwyg/files/drawing/10118194.pdf?src-supplier=Digi-Key; ComponentLink2URL: https://cdn.amphenol-icc.com/media/wysiwyg/files/drawing/10118194.pdf?src-supplier=Mouser; ComponentLink2Description: https://cdn.amphenol-icc.com/media/wysiwyg/files/drawing/10118194.pdf?src-supplier=Mouser; ComponentLink3URL: https://cdn.amphenol-icc.com/media/wysiwyg/files/drawing/10118194.pdf?src-supplier=Verical; ComponentLink3Description: https://cdn.amphenol-icc.com/media/wysiwyg/files/drawing/10118194.pdf?src-supplier=Verical; Supplier Part Number 1: 609-4618-1-ND; LCSC Part Number: C132563
J3 = 5 Test Pad: Wire Connecting Pad; Item Type: Test Point; Manufacturer Part Number: 5 Test Pad
L1 = LQP03TN2N7B02D: FIXED IND 2.7NH 500MA 200MOHM SM; Manufacturer: Murata; Core Material: Non-Magnetic; Self Resonant Frequency: 6GHz; Tolerance: 3%; Shielding: Unshielded; DC Resistance (DCR): 200mR; Q Factor: 14; Current: 350mA; Test Frequency: 500MHz; Item Type: Inductor; Supplier 1: Rs; Manufacturer Part Number: LQP03TN2N7B02D; RoHS: Yes; Category: Fixed Inductors; Stock 1: 4000; Pricing 1: 200=0.007 (GBP); Mount: Surface Mount; Case/Package: 0201; Case Code (Metric): 0603; Case Code (Imperial): 0201; Min Operating Temperature: -55°C; Max Operating Temperature: 125°C; Packaging: Tape and Reel; Package Quantity: 1; Current Rating: 500mA; Inductance: 2.7nH; Max DC Current: 500mA; Termination: SMD/SMT; DC Current: 500mA; Series: LQP03TN_02; Technology: THIN FILM; Length: 0.024inch; Width: 0.012inch; Height: 0.3mm; Height - Seated (Max): 0.013inch; Depth: 0.33mm; Military Standard: Not; Reach SVHC Compliant: No; Lead Free: Lead Free; RoHS Compliant: Yes; ComponentLink1URL: http://www.farnell.com/datasheets/1888743.pdf?src-supplier=Farnell; ComponentLink1Description: http://www.farnell.com/datasheets/1888743.pdf?src-supplier=Farnell; ComponentLink2URL: http://www.mouser.com/ds/2/281/c51e-794816.pdf?src-supplier=Mouser; ComponentLink2Description: http://www.mouser.com/ds/2/281/c51e-794816.pdf?src-supplier=Mouser; ComponentLink3URL: https://media.digikey.com/pdf/Data%20Sheets/Murata%20PDFs/LQP03_Series_Br.pdf?src-supplier=Digi-Key; ComponentLink3Description: https://media.digikey.com/pdf/Data%20Sheets/Murata%20PDFs/LQP03_Series_Br.pdf?src-supplier=Digi-Key; ComponentLink4URL: http://components.arrow.com/part/dataview/49670632S8721729N2606?src-supplier=Arrow+Electronics; ComponentLink4Description: http://components.arrow.com/part/dataview/49670632S8721729N2606?src-supplier=Arrow+Electronics; ComponentLink5URL: https://datasheet.octopart.com/LQP03TN2N7B02D-Murata-datasheet-26765549.pdf?src-supplier=Future+Electronics; ComponentLink5Description: https://datasheet.octopart.com/LQP03TN2N7B02D-Murata-datasheet-26765549.pdf?src-supplier=Future+Electronics; ComponentLink6URL: http://psearch.en.murata.com/inductor/product/LQP03TN2N7B02%23.pdf?src-supplier=Avnet; ComponentLink6Description: http://psearch.en.murata.com/inductor/product/LQP03TN2N7B02%23.pdf?src-supplier=Avnet; ComponentLink7URL: http://search.murata.co.jp/Ceramy/image/img/w_hinm/S0084E.pdf?src-supplier=Digi-Key; ComponentLink7Description: http://search.murata.co.jp/Ceramy/image/img/w_hinm/S0084E.pdf?src-supplier=Digi-Key; ComponentLink8URL: http://www.farnell.com/datasheets/1888743.pdf?src-supplier=Newark; ComponentLink8Description: http://www.farnell.com/datasheets/1888743.pdf?src-supplier=Newark; ComponentLink9URL: http://www.farnell.com/datasheets/1888743.pdf?src-supplier=Element14; ComponentLink9Description: http://www.farnell.com/datasheets/1888743.pdf?src-supplier=Element14; ComponentLink10URL: https://datasheet.octopart.com/LQP03TN2N7B02D-Murata-datasheet-141404629.pdf?src-supplier=TME; ComponentLink10Description: https://datasheet.octopart.com/LQP03TN2N7B02D-Murata-datasheet-141404629.pdf?src-supplier=TME; Supplier Part Number 1: 1065349; LCSC Part Number: C98043
L2 L3 = LQM18FN100M00D: FIXED IND 10UH 50MA 1.17 OHM SMD; Manufacturer: Murata; Core Material: Ferrite; Self Resonant Frequency: 30MHz; Shielding: Shielded; Tolerance: 20%; DC Resistance (DCR): 1.17R; Test Frequency: 1MHz; Item Type: Inductor; Supplier: Rs; Supplier Part Number: 7242696; Manufacturer Part Number: LQM18FN100M00D; RoHS: Yes; Category: Fixed Inductors; Stock: 525; Pricing: 25=0.11, 50=0.093, 500=0.082, 1000=0.071, 2500=0.066 (GBP); Mounting Technology: Surface Mount; Case/Package: 0603; Case Code (Metric): 1608; Case Code (Imperial): 0603; Min Operating Temperature: -55°C; Max Operating Temperature: 125°C; Packaging: Tape and Reel; Package Quantity: 4000; Current Rating: 50mA; Value: 10uH; Saturation Current: 50mA; Max DC Current: 50mA; Termination: SMD/SMT; DC Current: 50mA; Series: LQM18F; Length: 0.063inch; Width: 0.031inch; Height: 0.9mm; Height - Seated (Max): 0.035inch; Depth: 0.9mm; Military Standard: Not; Lead Free: Lead Free; RoHS Compliant: Yes; ComponentLink1URL: https://datasheet.ciiva.com/11799/0900766b80f15512-11799471.pdf?src-supplier=Rs; ComponentLink1Description: https://datasheet.ciiva.com/11799/0900766b80f15512-11799471.pdf?src-supplier=Rs; ComponentLink2URL: https://datasheet.ciiva.com/3865/286lqm18fn100m0023-3865365.pdf?src-supplier=Arrow+Electronics; ComponentLink2Description: https://datasheet.ciiva.com/3865/286lqm18fn100m0023-3865365.pdf?src-supplier=Arrow+Electronics; ComponentLink3URL: https://datasheet.ciiva.com/1039/l0075s0097lqm18f-1039418.pdf?src-supplier=Digi-Key; ComponentLink3Description: https://datasheet.ciiva.com/1039/l0075s0097lqm18f-1039418.pdf?src-supplier=Digi-Key; ComponentLink4URL: https://datasheet.ciiva.com/1039/l0075s0097lqm18f-1039417.pdf?src-supplier=Digi-Key; ComponentLink4Description: https://datasheet.ciiva.com/1039/l0075s0097lqm18f-1039417.pdf?src-supplier=Digi-Key; ComponentLink5URL: https://datasheet.ciiva.com/1039/l0075s0097lqm18f-1039419.pdf?src-supplier=Digi-Key; ComponentLink5Description: https://datasheet.ciiva.com/1039/l0075s0097lqm18f-1039419.pdf?src-supplier=Digi-Key; ComponentLink6URL: https://datasheet.ciiva.com/8510/l0075s0097lqm18f-8510087.pdf?src-supplier=Avnet; ComponentLink6Description: https://datasheet.ciiva.com/8510/l0075s0097lqm18f-8510087.pdf?src-supplier=Avnet; LCSC Part Number: C86083
LED1 = NCD0603B3: blue 0603 Light Emitting Diodes (LED) ROHS; Manufacturer: Foshan NationStar Optoelectronics; Manufacturer Part Number: NCD0603B3; Package: 0603; LCSC Part Number: C158101; Item Type: LED; ComponentLink1Description: LCSC; ComponentLink1URL: https://www.lcsc.com/product-detail/Light-Emitting-Diodes-LED_Foshan-NationStar-Optoelectronics-NCD0603B3_C158101.html
LED2 = NCD0603R3: RED LED 0603 Light Emitting Diodes; Manufacturer: Foshan NationStar Optoelectronics; Manufacturer Part Number: NCD0603R3; Package: 0603; Item Type: LED; LCSC Part Number: C3151730; ComponentLink1Description: LCSC; ComponentLink1URL: https://www.lcsc.com/product-detail/Light-Emitting-Diodes-LED_Foshan-NationStar-Optoelectronics-NCD0603R3_C3151730.html
P1-P3 = TEST POINT 0.5mm Dia: Test Point ON; Item Type: Test Point
R1 = RC0201FR-071KP: as R6 on sheet Touch_Amplifier; Supplier 1: Digi-Key; Manufacturer Part Number: RC0201FR-071KP; RoHS: Yes; Stock 1: 4800; Pricing 1: 1=0.11000, 10=0.10200, 100=0.03940, 1000=0.01734, 2500=0.01497, 5000=0.01340 (USD); RoHS Compliant: Yes; Supplier Part Number 1: 13-RC0201FR-071KPCT-ND; LCSC Part Number: C3953443
SW1 = B3U-1000P: SWITCH TACTILE SPST-NO 0.05A 12V; Manufacturer: Omron; Mechanical Life: 200000Cycles; Operating Force: 1.5N; Throw Configuration: SPST; Current Rating: 50mA; Contact Resistance: 100mR; Illumination Type: Non-Illuminated,Illuminated; Switch Travel: 0.15mm; Switch Function: Off-Mom; Actuator Type: Standard; Actuator Length: 0.4mm; Ratings: Dust Proof,IP40; ComponentLink1URL: http://www.farnell.com/datasheets/60838.pdf?src-supplier=Farnell; ComponentLink1Description: http://www.farnell.com/datasheets/60838.pdf?src-supplier=Farnell; ComponentLink2URL: http://www.farnell.com/datasheets/60838.pdf?src-supplier=Element14; ComponentLink2Description: http://www.farnell.com/datasheets/60838.pdf?src-supplier=Element14; ComponentLink3URL: https://omronfs.omron.com/en_US/ecb/products/pdf/en-b3u.pdf?src-supplier=Digi-Key; ComponentLink3Description: https://omronfs.omron.com/en_US/ecb/products/pdf/en-b3u.pdf?src-supplier=Digi-Key; ComponentLink4URL: http://www.omron.com/ecb/products/pdf/en-b3u.pdf?src-supplier=Digi-Key; ComponentLink4Description: http://www.omron.com/ecb/products/pdf/en-b3u.pdf?src-supplier=Digi-Key; ComponentLink5URL: https://www.distrelec.biz/Web/Downloads/he/et/B3U_eng_datasheet.pdf?mime=application%2Fpdf&src-supplier=Distrelec; ComponentLink5Description: https://www.distrelec.biz/Web/Downloads/he/et/B3U_eng_datasheet.pdf?mime=application%2Fpdf&src-supplier=Distrelec; ComponentLink6URL: http://www.onlinecomponents.com/productFiles/mf-OM/en-b3u.pdf?src-supplier=Onlinecomponents.com; ComponentLink6Description: http://www.onlinecomponents.com/productFiles/mf-OM/en-b3u.pdf?src-supplier=Onlinecomponents.com; Supplier 1: Digi-Key; Manufacturer Part Number: B3U-1000P; Stock 1: 116454; Pricing 1: 1=1, 10=0.961, 25=0.9064, 50=0.7976, 100=0.7251, 250=0.68888, 500=0.67074, 1000=0.52571 (USD); Mount: Surface Mount; Weight: 0.000776oz; Contact Material: Silver; Min Operating Temperature: -25°C; Max Operating Temperature: 70°C; Packaging: Tape and Reel; Voltage Rating (DC): 12V; Package Quantity: 1; Max Current Rating: 50mA; Termination: SMD/SMT; Orientation: Straight; Max Voltage Rating (DC): 12V; Electrical Life: 200000Cycles; Insulation Resistance: 100MR; Contact Current Rating: 50mA; Length: 4mm; Height: 1.2mm; Depth: 2.5mm; Width: 3mm; REACH SVHC: Unknown; Lead Free: Lead Free; ComponentLink7URL: https://www.verical.com/server-webapp/html/getDatasheet?partID=552554&src-supplier=Verical; ComponentLink7Description: https://www.verical.com/server-webapp/html/getDatasheet?partID=552554&src-supplier=Verical; ComponentLink8URL: http://www.farnell.com/datasheets/1685550.pdf?src-supplier=Element14; ComponentLink8Description: http://www.farnell.com/datasheets/1685550.pdf?src-supplier=Element14; ComponentLink9URL: http://www.farnell.com/datasheets/2610940.pdf?src-supplier=Farnell; ComponentLink9Description: http://www.farnell.com/datasheets/2610940.pdf?src-supplier=Farnell; ComponentLink10URL: https://www.alliedelec.com/m/d/4c8a9ef82804fc3c241a13c1e298fd73.pdf?src-supplier=Allied+Electronics; ComponentLink10Description: https://www.alliedelec.com/m/d/4c8a9ef82804fc3c241a13c1e298fd73.pdf?src-supplier=Allied+Electronics; Supplier Part Number 1: SW1020DKR-ND; LCSC Part Number: C231329; Item Type: Switch
U1 = IS2083BM-232: RF TXRX MODULE BLUETOOTH SMD; Manufacturer: Microchip Technology; Item Type: IC; Manufacturer Part Number: IS2083BM-232; Package: 82-VFBGA
X1 = CSTCE16M0V53-R0: 16MHz 15pF ±0.5%; Manufacturer: Murata; Impedance: 40R; Frequency Stability: 0.3%; Item Type: Cystal; Supplier 1: Farnell; Manufacturer Part Number: CSTCE16M0V53-R0; RoHS: Yes; Category: Capacitors; Pricing 1: 5=0.34500, 50=0.26100, 250=0.23600, 500=0.19400, 1500=0.18300, 3000=0.17100, 15000=0.16800 (GBP); Case/Package: SMD/SMT; Number of Pins: 3; Contact Plating: Gold; Weight: 0.001023oz; Min Operating Temperature: -20°C; Max Operating Temperature: 80°C; Frequency: 16MHz; Frequency Tolerance: 0.5%; Self Resonant Frequency: 16MHz; Load Capacitance: 15pF; Tolerance: 0.5%; Package Quantity: 3000; Capacitance: 15pF; Packaging: Tape and Reel; Termination: SMD/SMT; Resistor Type: Ceramic; Series: CERALOCK® CSTCE; Length: 3.2mm; Width: 1.3mm; Height: 0.9mm; Reach SVHC Compliant: Yes; Lead Free: Lead Free; RoHS Compliant: Yes; ComponentLink1URL: https://datasheet.ciiva.com/18183/getdatasheetpartid-152969-18183272.pdf?src-supplier=Verical; ComponentLink1Description: https://datasheet.ciiva.com/18183/getdatasheetpartid-152969-18183272.pdf?src-supplier=Verical; ComponentLink2URL: https://datasheet.ciiva.com/1361/1506176-1361293.pdf?src-supplier=Element14; ComponentLink2Description: https://datasheet.ciiva.com/1361/1506176-1361293.pdf?src-supplier=Element14; ComponentLink3URL: https://datasheet.ciiva.com/14132/ceralock-eng-bro-14132735.pdf?src-supplier=Distrelec; ComponentLink3Description: https://datasheet.ciiva.com/14132/ceralock-eng-bro-14132735.pdf?src-supplier=Distrelec; ComponentLink4URL: https://datasheet.ciiva.com/884/p16e-884478.pdf?src-supplier=Digi-Key; ComponentLink4Description: https://datasheet.ciiva.com/884/p16e-884478.pdf?src-supplier=Digi-Key; ComponentLink5URL: https://datasheet.ciiva.com/884/p16e-884477.pdf?src-supplier=Digi-Key; ComponentLink5Description: https://datasheet.ciiva.com/884/p16e-884477.pdf?src-supplier=Digi-Key; ComponentLink6URL: https://datasheet.ciiva.com/884/p16e-884479.pdf?src-supplier=Digi-Key; ComponentLink6Description: https://datasheet.ciiva.com/884/p16e-884479.pdf?src-supplier=Digi-Key; ComponentLink7URL: https://datasheet.ciiva.com/16216/l0430e-16216847.pdf?src-supplier=Future+Electronics; ComponentLink7Description: https://datasheet.ciiva.com/16216/l0430e-16216847.pdf?src-supplier=Future+Electronics; Supplier Part Number 1: 2443265; LCSC Part Number: C32180

## Nets that join several sheets
GND: Touch_Amplifier (16 pins), Bluetooth_SOC (42 pins)
VBAT: Touch_Amplifier (16 pins), Bluetooth_SOC (C2.1 J1.1 U1.G1)
AOHPL: Touch_Amplifier (C28.1), Bluetooth_SOC (U1.A2)
EASY_TUNE: Touch_Amplifier (SB6.1), Bluetooth_SOC (U1.E6)
OUT_0: Touch_Amplifier (R3.1 U3.4), Bluetooth_SOC (U1.E8)
OUT_1: Touch_Amplifier (R4.1 U3.2), Bluetooth_SOC (U1.D9)
OUT_2: Touch_Amplifier (R5.1 U3.1), Bluetooth_SOC (U1.E9)
SINGLE_BUTTON: Touch_Amplifier (SB5.1), Bluetooth_SOC (U1.H2)